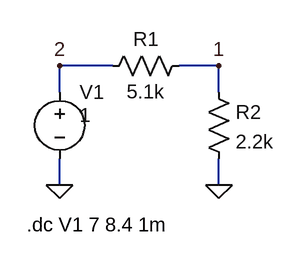
[diagram p0: schematic vbat_divider.asc]
vbat_divider.asc, the LTspice schematic file:
Version 4
SHEET 1 880 680
WIRE 208 64 144 64
WIRE 336 64 288 64
WIRE 144 96 144 64
WIRE 336 96 336 64
WIRE 144 208 144 176
WIRE 336 208 336 176
FLAG 336 208 0
FLAG 144 208 0
FLAG 336 64 1
FLAG 144 64 2
SYMBOL voltage 144 80 R0
WINDOW 3 24 44 Left 2
WINDOW 123 0 0 Left 0
WINDOW 39 0 0 Left 0
SYMATTR InstName V1
SYMATTR Value 1
SYMBOL res 192 80 R270
WINDOW 0 32 56 VTop 2
WINDOW 3 0 56 VBottom 2
SYMATTR InstName R1
SYMATTR Value 5.1k
SYMBOL res 320 80 R0
SYMATTR InstName R2
SYMATTR Value 2.2k
TEXT 104 256 Left 2 !.dc V1 7 8.4 1m

The netlist it stands for:
* vbat_divider.asc
V1 2 0 1
R1 2 1 5.1k
R2 1 0 2.2k
.dc V1 7 8.4 1m
.backanno
.end